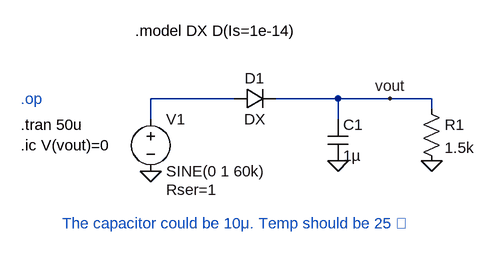
[diagram p0: schematic half_rectifier.asc]
half_rectifier.asc, the LTspice schematic file:
Version 4.1
SHEET 1 880 680
WIRE 208 96 80 96
WIRE 368 96 272 96
WIRE 448 96 368 96
WIRE 512 96 448 96
WIRE 512 112 512 96
WIRE 80 128 80 96
WIRE 368 128 368 96
FLAG 80 208 0
FLAG 368 192 0
FLAG 512 192 0
FLAG 448 96 vout
SYMBOL voltage 80 112 R0
WINDOW 123 0 0 Left 0
WINDOW 39 24 124 Left 2
SYMATTR InstName V1
SYMATTR Value SINE(0 1 60k)
SYMATTR SpiceLine Rser=1
SYMBOL diode 208 112 R270
WINDOW 0 32 32 VTop 2
WINDOW 3 0 32 VBottom 2
SYMATTR InstName D1
SYMATTR Value DX
SYMBOL cap 352 128 R0
SYMATTR InstName C1
SYMATTR Value 1µ
SYMBOL res 496 96 R0
SYMATTR InstName R1
SYMATTR Value 1.5k
TEXT -120 96 Left 2 ;.op
TEXT -120 136 Left 2 !.tran 50u
TEXT -120 168 Left 2 !.ic V(vout)=0
TEXT -56 288 Left 2 ;The capacitor could be 10μ. Temp should be 25 ℃
TEXT 56 -8 Left 2 !.model DX D(Is=1e-14)

The netlist it stands for:
* half_rectifier.asc
V1 N001 0 SINE(0 1 60k) Rser=1
D1 N001 vout DX
C1 vout 0 1µ
R1 vout 0 1.5k
.model D D
.lib standard.dio
* .op
.tran 50u
.ic V(vout)=0
* The capacitor could be 10μ. Temp should be 25 ℃
.model DX D(Is=1e-14)
.backanno
.end